# Altium schematic sheet IDC_AIO_ELOAD.SchDoc
size A4; SheetNumber: 1; SheetTotal: 1
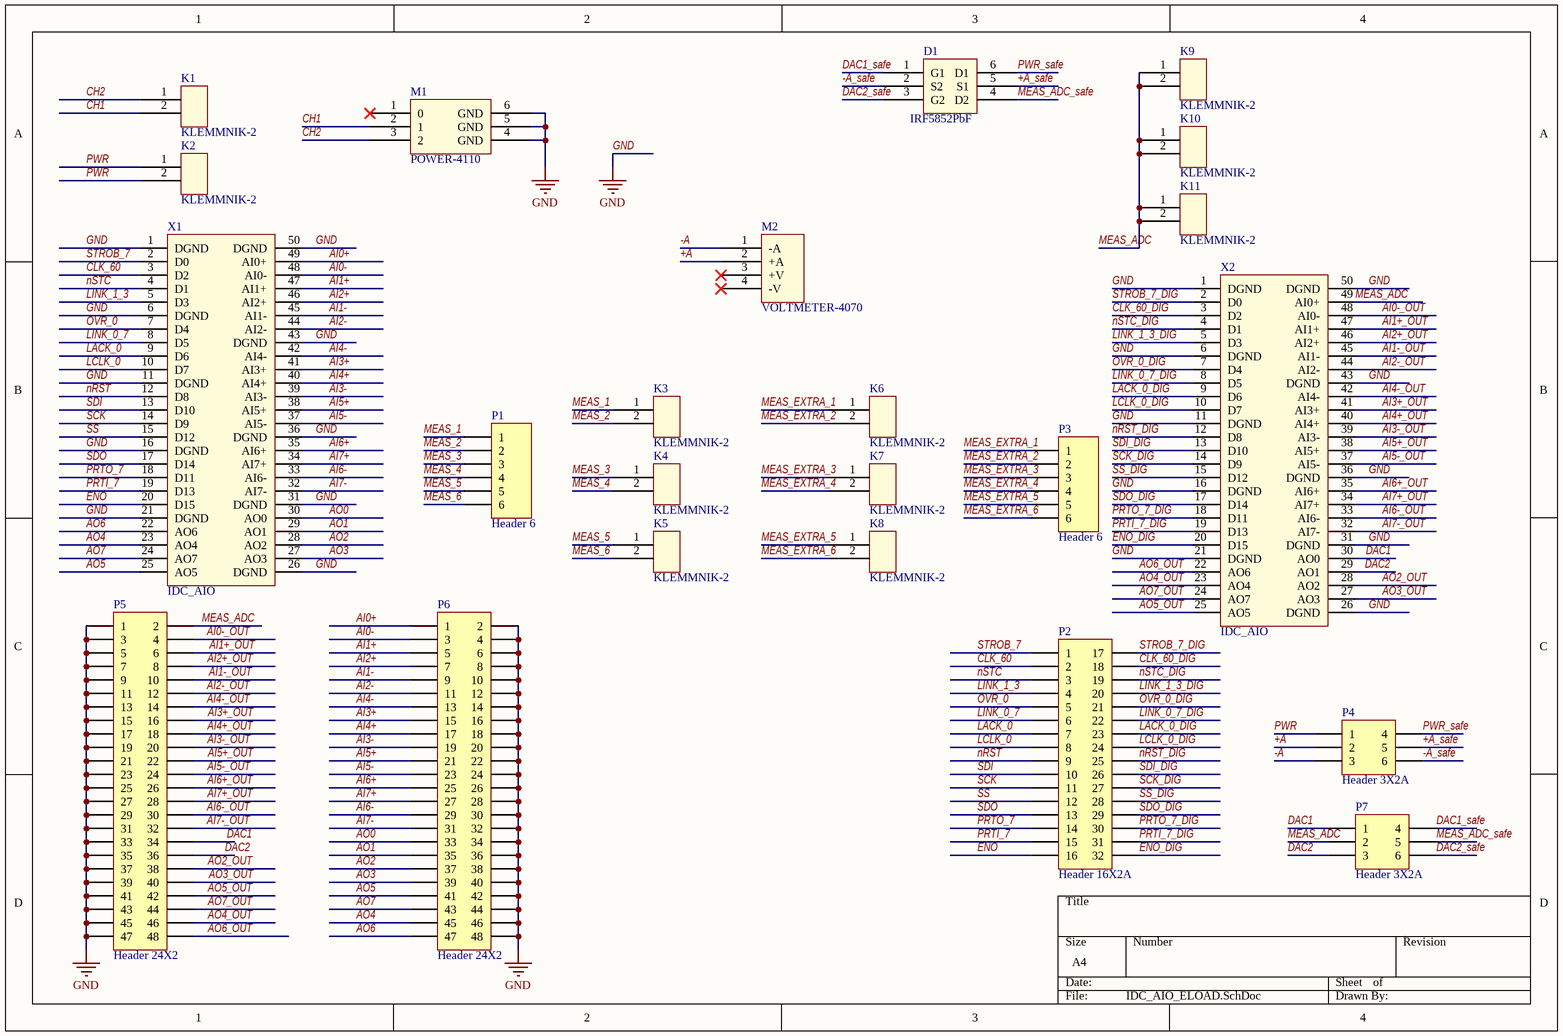
[diagram p0: IDC_AIO_ELOAD.SchDoc]

## Parts
D1  IRF5852PbF  [IRF5852PbF]
K1  KLEMMNIK-2  [KLEMMNIK-2]
K2  KLEMMNIK-2  [KLEMMNIK-2]
K3  KLEMMNIK-2  [KLEMMNIK-2]
K4  KLEMMNIK-2  [KLEMMNIK-2]
K5  KLEMMNIK-2  [KLEMMNIK-2]
K6  KLEMMNIK-2  [KLEMMNIK-2]
K7  KLEMMNIK-2  [KLEMMNIK-2]
K8  KLEMMNIK-2  [KLEMMNIK-2]
K9  KLEMMNIK-2  [KLEMMNIK-2]
K10  KLEMMNIK-2  [KLEMMNIK-2]
K11  KLEMMNIK-2  [KLEMMNIK-2]
M1  POWER-4110  [POWER-4110]
M2  VOLTMETER-4070  [VOLTMETER-4070]
P1  Header 6  [HDR1X6]
P2  Header 16X2A  [HDR2X16_CEN]
P3  Header 6  [HDR1X6]
P4  Header 3X2A  [HDR2X3_CEN]
P5  Header 24X2  [HDR2X24]
P6  Header 24X2  [HDR2X24]
P7  Header 3X2A  [HDR2X3_CEN]
X1  IDC_AIO  [IDC_AIO]
X2  IDC_AIO  [IDC_AIO]

## Nets
GND: M1.4(GND) M1.5(GND) M1.6(GND) P5.1 P5.3 P5.5 P5.7 P5.9 P5.11 P5.13 P5.15 P5.17 P5.19 P5.21 P5.23 P5.25 P5.27 P5.29 P5.31 P5.33 P5.35 P5.37 P5.39 P5.41 P5.43 P5.45 P5.47 P6.2 P6.4 P6.6 P6.8 P6.10 P6.12 P6.14 P6.16 P6.18 P6.20 P6.22 P6.24 P6.26 P6.28 P6.30 P6.32 P6.34 P6.36 P6.38 P6.40 P6.42 P6.44 P6.46 P6.48 X1.1(DGND) X1.6(DGND) X1.11(DGND) X1.16(DGND) X1.21(DGND) X1.26(DGND) X1.31(DGND) X1.36(DGND) X1.43(DGND) X1.50(DGND) X2.1(DGND) X2.6(DGND) X2.11(DGND) X2.16(DGND) X2.21(DGND) X2.26(DGND) X2.31(DGND) X2.36(DGND) X2.43(DGND) X2.50(DGND)
+A: M2.2(+A) P4.2
+A_safe: D1.5(S1) P4.5
-A: M2.1(-A) P4.3
-A_safe: D1.2(S2) P4.6
AI0+: P6.1 X1.49(AI0+)
AI0-: P6.3 X1.48(AI0-)
AI0-_OUT: P5.4 X2.48(AI0-)
AI1+: P6.5 X1.47(AI1+)
AI1+_OUT: P5.6 X2.47(AI1+)
AI1-: P6.9 X1.45(AI1-)
AI1-_OUT: P5.10 X2.45(AI1-)
AI2+: P6.7 X1.46(AI2+)
AI2+_OUT: P5.8 X2.46(AI2+)
AI2-: P6.11 X1.44(AI2-)
AI2-_OUT: P5.12 X2.44(AI2-)
AI3+: P6.15 X1.41(AI3+)
AI3+_OUT: P5.16 X2.41(AI3+)
AI3-: P6.19 X1.39(AI3-)
AI3-_OUT: P5.20 X2.39(AI3-)
AI4+: P6.17 X1.40(AI4+)
AI4+_OUT: P5.18 X2.40(AI4+)
AI4-: P6.13 X1.42(AI4-)
AI4-_OUT: P5.14 X2.42(AI4-)
AI5+: P6.21 X1.38(AI5+)
AI5+_OUT: P5.22 X2.38(AI5+)
AI5-: P6.23 X1.37(AI5-)
AI5-_OUT: P5.24 X2.37(AI5-)
AI6+: P6.25 X1.35(AI6+)
AI6+_OUT: P5.26 X2.35(AI6+)
AI6-: P6.29 X1.33(AI6-)
AI6-_OUT: P5.30 X2.33(AI6-)
AI7+: P6.27 X1.34(AI7+)
AI7+_OUT: P5.28 X2.34(AI7+)
AI7-: P6.31 X1.32(AI7-)
AI7-_OUT: P5.32 X2.32(AI7-)
AO0: P6.33 X1.30(AO0)
AO1: P6.35 X1.29(AO1)
AO2: P6.37 X1.28(AO2)
AO2_OUT: P5.38 X2.28(AO2)
AO3: P6.39 X1.27(AO3)
AO3_OUT: P5.40 X2.27(AO3)
AO4: P6.45 X1.23(AO4)
AO4_OUT: P5.46 X2.23(AO4)
AO5: P6.41 X1.25(AO5)
AO5_OUT: P5.42 X2.25(AO5)
AO6: P6.47 X1.22(AO6)
AO6_OUT: P5.48 X2.22(AO6)
AO7: P6.43 X1.24(AO7)
AO7_OUT: P5.44 X2.24(AO7)
CH1: K1.2 M1.2(1)
CH2: K1.1 M1.3(2)
CLK_60: P2.2 X1.3(D2)
CLK_60_DIG: P2.18 X2.3(D2)
DAC1: P5.34 P7.1 X2.30(AO0)
DAC1_safe: D1.1(G1) P7.4
DAC2: P5.36 P7.3 X2.29(AO1)
DAC2_safe: D1.3(G2) P7.6
ENO: P2.16 X1.20(D15)
ENO_DIG: P2.32 X2.20(D15)
LACK_0: P2.7 X1.9(D6)
LACK_0_DIG: P2.23 X2.9(D6)
LCLK_0: P2.8 X1.10(D7)
LCLK_0_DIG: P2.24 X2.10(D7)
LINK_0_7: P2.6 X1.8(D5)
LINK_0_7_DIG: P2.22 X2.8(D5)
LINK_1_3: P2.4 X1.5(D3)
LINK_1_3_DIG: P2.20 X2.5(D3)
MEAS_1: K3.1 P1.1
MEAS_2: K3.2 P1.2
MEAS_3: K4.1 P1.3
MEAS_4: K4.2 P1.4
MEAS_5: K5.1 P1.5
MEAS_6: K5.2 P1.6
MEAS_ADC: K9.1 K9.2 K10.1 K10.2 K11.1 K11.2 P5.2 P7.2 X2.49(AI0+)
MEAS_ADC_safe: D1.4(D2) P7.5
MEAS_EXTRA_1: K6.1 P3.1
MEAS_EXTRA_2: K6.2 P3.2
MEAS_EXTRA_3: K7.1 P3.3
MEAS_EXTRA_4: K7.2 P3.4
MEAS_EXTRA_5: K8.1 P3.5
MEAS_EXTRA_6: K8.2 P3.6
nRST: P2.9 X1.12(D8)
nRST_DIG: P2.25 X2.12(D8)
nSTC: P2.3 X1.4(D1)
nSTC_DIG: P2.19 X2.4(D1)
OVR_0: P2.5 X1.7(D4)
OVR_0_DIG: P2.21 X2.7(D4)
PRTI_7: P2.15 X1.19(D13)
PRTI_7_DIG: P2.31 X2.19(D13)
PRTO_7: P2.14 X1.18(D11)
PRTO_7_DIG: P2.30 X2.18(D11)
PWR: K2.1 K2.2 P4.1
PWR_safe: D1.6(D1) P4.4
SCK: P2.11 X1.14(D9)
SCK_DIG: P2.27 X2.14(D9)
SDI: P2.10 X1.13(D10)
SDI_DIG: P2.26 X2.13(D10)
SDO: P2.13 X1.17(D14)
SDO_DIG: P2.29 X2.17(D14)
SS: P2.12 X1.15(D12)
SS_DIG: P2.28 X2.15(D12)
STROB_7: P2.1 X1.2(D0)
STROB_7_DIG: P2.17 X2.2(D0)

Not connected (* = marked no-connect by the designer): M1 1(0)*; M2 3(+V)* 4(-V)*

## Library data of the parts
P1 P3 = Header 6: Header, 6-Pin; LatestRevisionDate: 17-Jul-2002; LatestRevisionNote: Re-released for DXP Platform.; Publisher: Altium Limited
P2 = Header 16X2A: Header, 16-Pin, Dual row; LatestRevisionDate: 17-Jul-2002; LatestRevisionNote: Re-released for DXP Platform.; Publisher: Altium Limited
P4 P7 = Header 3X2A: Header, 3-Pin, Dual row; LatestRevisionDate: 17-Jul-2002; LatestRevisionNote: Re-released for DXP Platform.; Publisher: Altium Limited
P5 P6 = Header 24X2: Header, 24-Pin, Dual row; LatestRevisionDate: 17-Jul-2002; LatestRevisionNote: Re-released for DXP Platform.; Publisher: Altium Limited